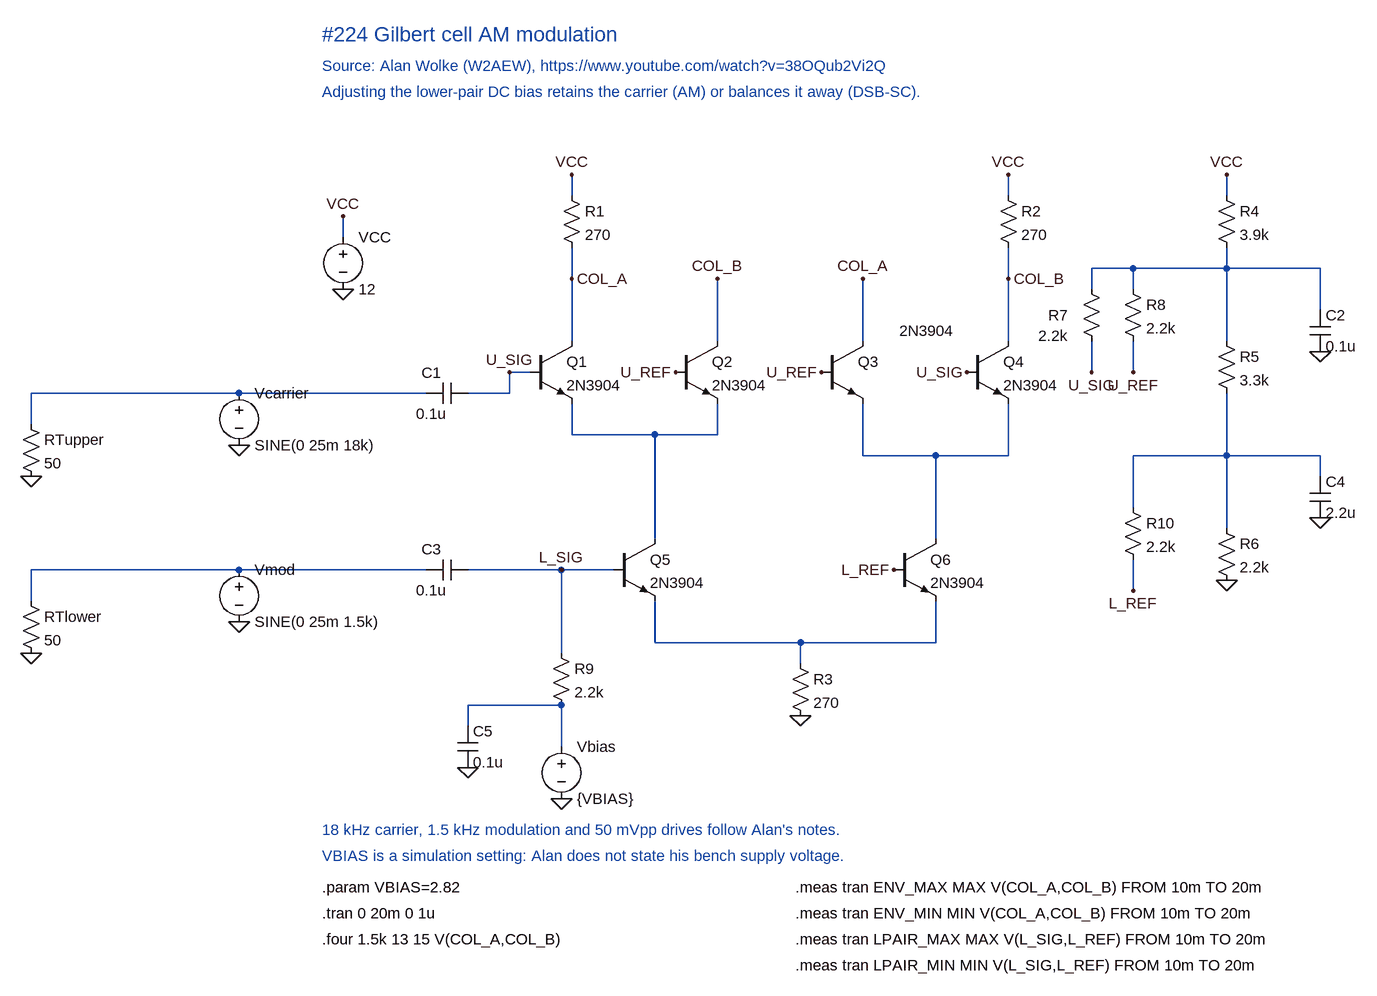
[diagram p0: schematic Gilbert cell AM.asc]
Gilbert cell AM.asc, the LTspice schematic file:
Version 4
SHEET 1 1800 1250
SYMBOL voltage 64 320 R0
SYMATTR InstName VCC
SYMATTR Value 12
WIRE 64 304 64 336
FLAG 64 304 VCC
FLAG 64 416 0
SYMBOL res 400 256 R0
SYMATTR InstName R1
SYMATTR Value 270
WIRE 416 240 416 272
FLAG 416 240 VCC
WIRE 416 352 416 496
FLAG 416 400 COL_A
SYMBOL res 1072 256 R0
SYMATTR InstName R2
SYMATTR Value 270
WIRE 1088 240 1088 272
FLAG 1088 240 VCC
WIRE 1088 352 1088 496
FLAG 1088 400 COL_B
SYMBOL npn 352 496 R0
SYMATTR InstName Q1
SYMATTR Value 2N3904
SYMBOL npn 576 496 R0
SYMATTR InstName Q2
SYMATTR Value 2N3904
SYMBOL npn 800 496 R0
WINDOW 3 120 -16 Left 2
SYMATTR InstName Q3
SYMATTR Value 2N3904
SYMBOL npn 1024 496 R0
SYMATTR InstName Q4
SYMATTR Value 2N3904
WIRE 640 400 640 496
FLAG 640 400 COL_B
WIRE 864 400 864 496
FLAG 864 400 COL_A
WIRE 416 592 416 640
WIRE 416 640 640 640
WIRE 640 592 640 640
WIRE 544 640 544 800
WIRE 864 592 864 672
WIRE 864 672 1088 672
WIRE 1088 592 1088 672
WIRE 976 672 976 800
SYMBOL npn 480 800 R0
SYMATTR InstName Q5
SYMATTR Value 2N3904
SYMBOL npn 912 800 R0
SYMATTR InstName Q6
SYMATTR Value 2N3904
WIRE 544 896 544 960
WIRE 544 960 976 960
WIRE 976 896 976 960
SYMBOL res 752 976 R0
SYMATTR InstName R3
SYMATTR Value 270
WIRE 768 960 768 992
FLAG 768 1072 0
SYMBOL voltage -96 560 R0
SYMATTR InstName Vcarrier
SYMATTR Value SINE(0 25m 18k)
WIRE -416 576 -96 576
FLAG -96 656 0
SYMBOL cap 256 560 R90
WINDOW 0 0 56 VBottom 2
WINDOW 3 32 56 VTop 2
SYMATTR InstName C1
SYMATTR Value 0.1u
WIRE -96 576 192 576
WIRE -416 576 -416 624
SYMBOL res -432 608 R0
SYMATTR InstName RTupper
SYMATTR Value 50
FLAG -416 704 0
WIRE 256 576 320 576
WIRE 320 544 320 576
WIRE 320 544 352 544
FLAG 320 544 U_SIG
FLAG 1024 544 U_SIG
FLAG 576 544 U_REF
FLAG 800 544 U_REF
SYMBOL voltage -96 832 R0
SYMATTR InstName Vmod
SYMATTR Value SINE(0 25m 1.5k)
WIRE -416 848 -96 848
FLAG -96 928 0
SYMBOL cap 256 832 R90
WINDOW 0 0 56 VBottom 2
WINDOW 3 32 56 VTop 2
SYMATTR InstName C3
SYMATTR Value 0.1u
WIRE -96 848 192 848
WIRE -416 848 -416 896
SYMBOL res -432 880 R0
SYMATTR InstName RTlower
SYMATTR Value 50
FLAG -416 976 0
WIRE 256 848 480 848
FLAG 400 848 L_SIG
FLAG 912 848 L_REF
SYMBOL res 1408 256 R0
SYMATTR InstName R4
SYMATTR Value 3.9k
WIRE 1424 240 1424 272
FLAG 1424 240 VCC
SYMBOL res 1408 480 R0
SYMATTR InstName R5
SYMATTR Value 3.3k
WIRE 1424 352 1424 496
SYMBOL res 1408 768 R0
SYMATTR InstName R6
SYMATTR Value 2.2k
WIRE 1424 576 1424 784
FLAG 1424 864 0
WIRE 1216 384 1424 384
WIRE 1216 384 1216 416
WIRE 1280 384 1280 416
SYMBOL res 1200 400 R0
WINDOW 0 -20 56 Right 2
WINDOW 3 -20 88 Right 2
SYMATTR InstName R7
SYMATTR Value 2.2k
SYMBOL res 1264 400 R0
SYMATTR InstName R8
SYMATTR Value 2.2k
WIRE 1216 496 1216 544
WIRE 1280 496 1280 544
FLAG 1216 544 U_SIG
FLAG 1280 544 U_REF
WIRE 1280 672 1424 672
WIRE 1280 672 1280 752
SYMBOL res 1264 736 R0
SYMATTR InstName R10
SYMATTR Value 2.2k
WIRE 1280 832 1280 880
FLAG 1280 880 L_REF
SYMBOL cap 1552 448 R0
SYMATTR InstName C2
SYMATTR Value 0.1u
WIRE 1424 384 1568 384
WIRE 1568 384 1568 448
FLAG 1568 512 0
SYMBOL cap 1552 704 R0
SYMATTR InstName C4
SYMATTR Value 2.2u
WIRE 1424 672 1568 672
WIRE 1568 672 1568 704
FLAG 1568 768 0
SYMBOL res 384 960 R0
SYMATTR InstName R9
SYMATTR Value 2.2k
WIRE 400 848 400 976
WIRE 400 1056 400 1120
SYMBOL voltage 400 1104 R0
SYMATTR InstName Vbias
SYMATTR Value {VBIAS}
FLAG 400 1200 0
SYMBOL cap 240 1088 R0
SYMATTR InstName C5
SYMATTR Value 0.1u
WIRE 256 1056 400 1056
WIRE 256 1056 256 1088
FLAG 256 1152 0
TEXT 32 24 Left 3 ;#224 Gilbert cell AM modulation
TEXT 32 72 Left 2 ;Source: Alan Wolke (W2AEW), https://www.youtube.com/watch?v=38OQub2Vi2Q
TEXT 32 112 Left 2 ;Adjusting the lower-pair DC bias retains the carrier (AM) or balances it away (DSB-SC).
TEXT 32 1248 Left 2 ;18 kHz carrier, 1.5 kHz modulation and 50 mVpp drives follow Alan's notes.
TEXT 32 1288 Left 2 ;VBIAS is a simulation setting: Alan does not state his bench supply voltage.
TEXT 32 1336 Left 2 !.param VBIAS=2.82
TEXT 32 1376 Left 2 !.tran 0 20m 0 1u
TEXT 32 1416 Left 2 !.four 1.5k 13 15 V(COL_A,COL_B)
TEXT 760 1336 Left 2 !.meas tran ENV_MAX MAX V(COL_A,COL_B) FROM 10m TO 20m
TEXT 760 1376 Left 2 !.meas tran ENV_MIN MIN V(COL_A,COL_B) FROM 10m TO 20m
TEXT 760 1416 Left 2 !.meas tran LPAIR_MAX MAX V(L_SIG,L_REF) FROM 10m TO 20m
TEXT 760 1456 Left 2 !.meas tran LPAIR_MIN MIN V(L_SIG,L_REF) FROM 10m TO 20m

The netlist it stands for:
* Gilbert cell AM.asc
VCC VCC 0 12
R1 VCC COL_A 270
R2 VCC COL_B 270
Q1 COL_A U_SIG N001 0 2N3904
Q2 COL_B U_REF N001 0 2N3904
Q3 COL_A U_REF N002 0 2N3904
Q4 COL_B U_SIG N002 0 2N3904
Q5 N001 L_SIG N003 0 2N3904
Q6 N002 L_REF N003 0 2N3904
R3 N003 0 270
Vcarrier N004 0 SINE(0 25m 18k)
C1 U_SIG N004 0.1u
RTupper N004 0 50
Vmod N005 0 SINE(0 25m 1.5k)
C3 L_SIG N005 0.1u
RTlower N005 0 50
R4 VCC N006 3.9k
R5 N006 N007 3.3k
R6 N007 0 2.2k
R7 N006 U_SIG 2.2k
R8 N006 U_REF 2.2k
R10 N007 L_REF 2.2k
C2 N006 0 0.1u
C4 N007 0 2.2u
R9 L_SIG N008 2.2k
Vbias N008 0 {VBIAS}
C5 N008 0 0.1u
.model NPN NPN
.model PNP PNP
.lib standard.bjt
* #224 Gilbert cell AM modulation
* Source: Alan Wolke (W2AEW), https://www.youtube.com/watch?v=38OQub2Vi2Q
* Adjusting the lower-pair DC bias retains the carrier (AM) or balances it away (DSB-SC).
* 18 kHz carrier, 1.5 kHz modulation and 50 mVpp drives follow Alan's notes.
* VBIAS is a simulation setting: Alan does not state his bench supply voltage.
.param VBIAS=2.82
.tran 0 20m 0 1u
.four 1.5k 13 15 V(COL_A,COL_B)
.meas tran ENV_MAX MAX V(COL_A,COL_B) FROM 10m TO 20m
.meas tran ENV_MIN MIN V(COL_A,COL_B) FROM 10m TO 20m
.meas tran LPAIR_MAX MAX V(L_SIG,L_REF) FROM 10m TO 20m
.meas tran LPAIR_MIN MIN V(L_SIG,L_REF) FROM 10m TO 20m
.backanno
.end